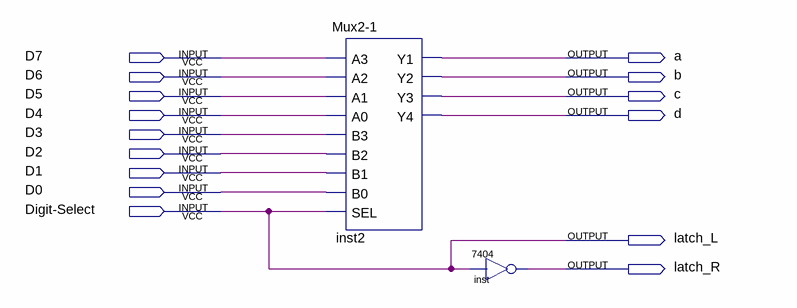
[diagram p0: schematic sheet]
// Quartus schematic Mux-HexDisplay.bdf as structural Verilog: 2 symbols, 15 pins
module \Mux-HexDisplay  (
  input  D7,
  input  D6,
  input  D5,
  input  D4,
  input  D3,
  input  D2,
  input  D1,
  input  D0,
  input  \Digit-Select ,
  output a,
  output b,
  output c,
  output d,
  output latch_L,
  output latch_R
);

  \Mux2-1  inst2 (
    .A3(D7), .A2(D6), .A1(D5), .A0(D4), .B3(D3), .B2(D2), .B1(D1), .B0(D0), .SEL(\Digit-Select ), .Y1(a),
    .Y2(b), .Y3(c), .Y4(d));
  \7404  inst (.\2 (\Digit-Select ), .\1 (latch_R));

  assign latch_L = \Digit-Select ;
endmodule
